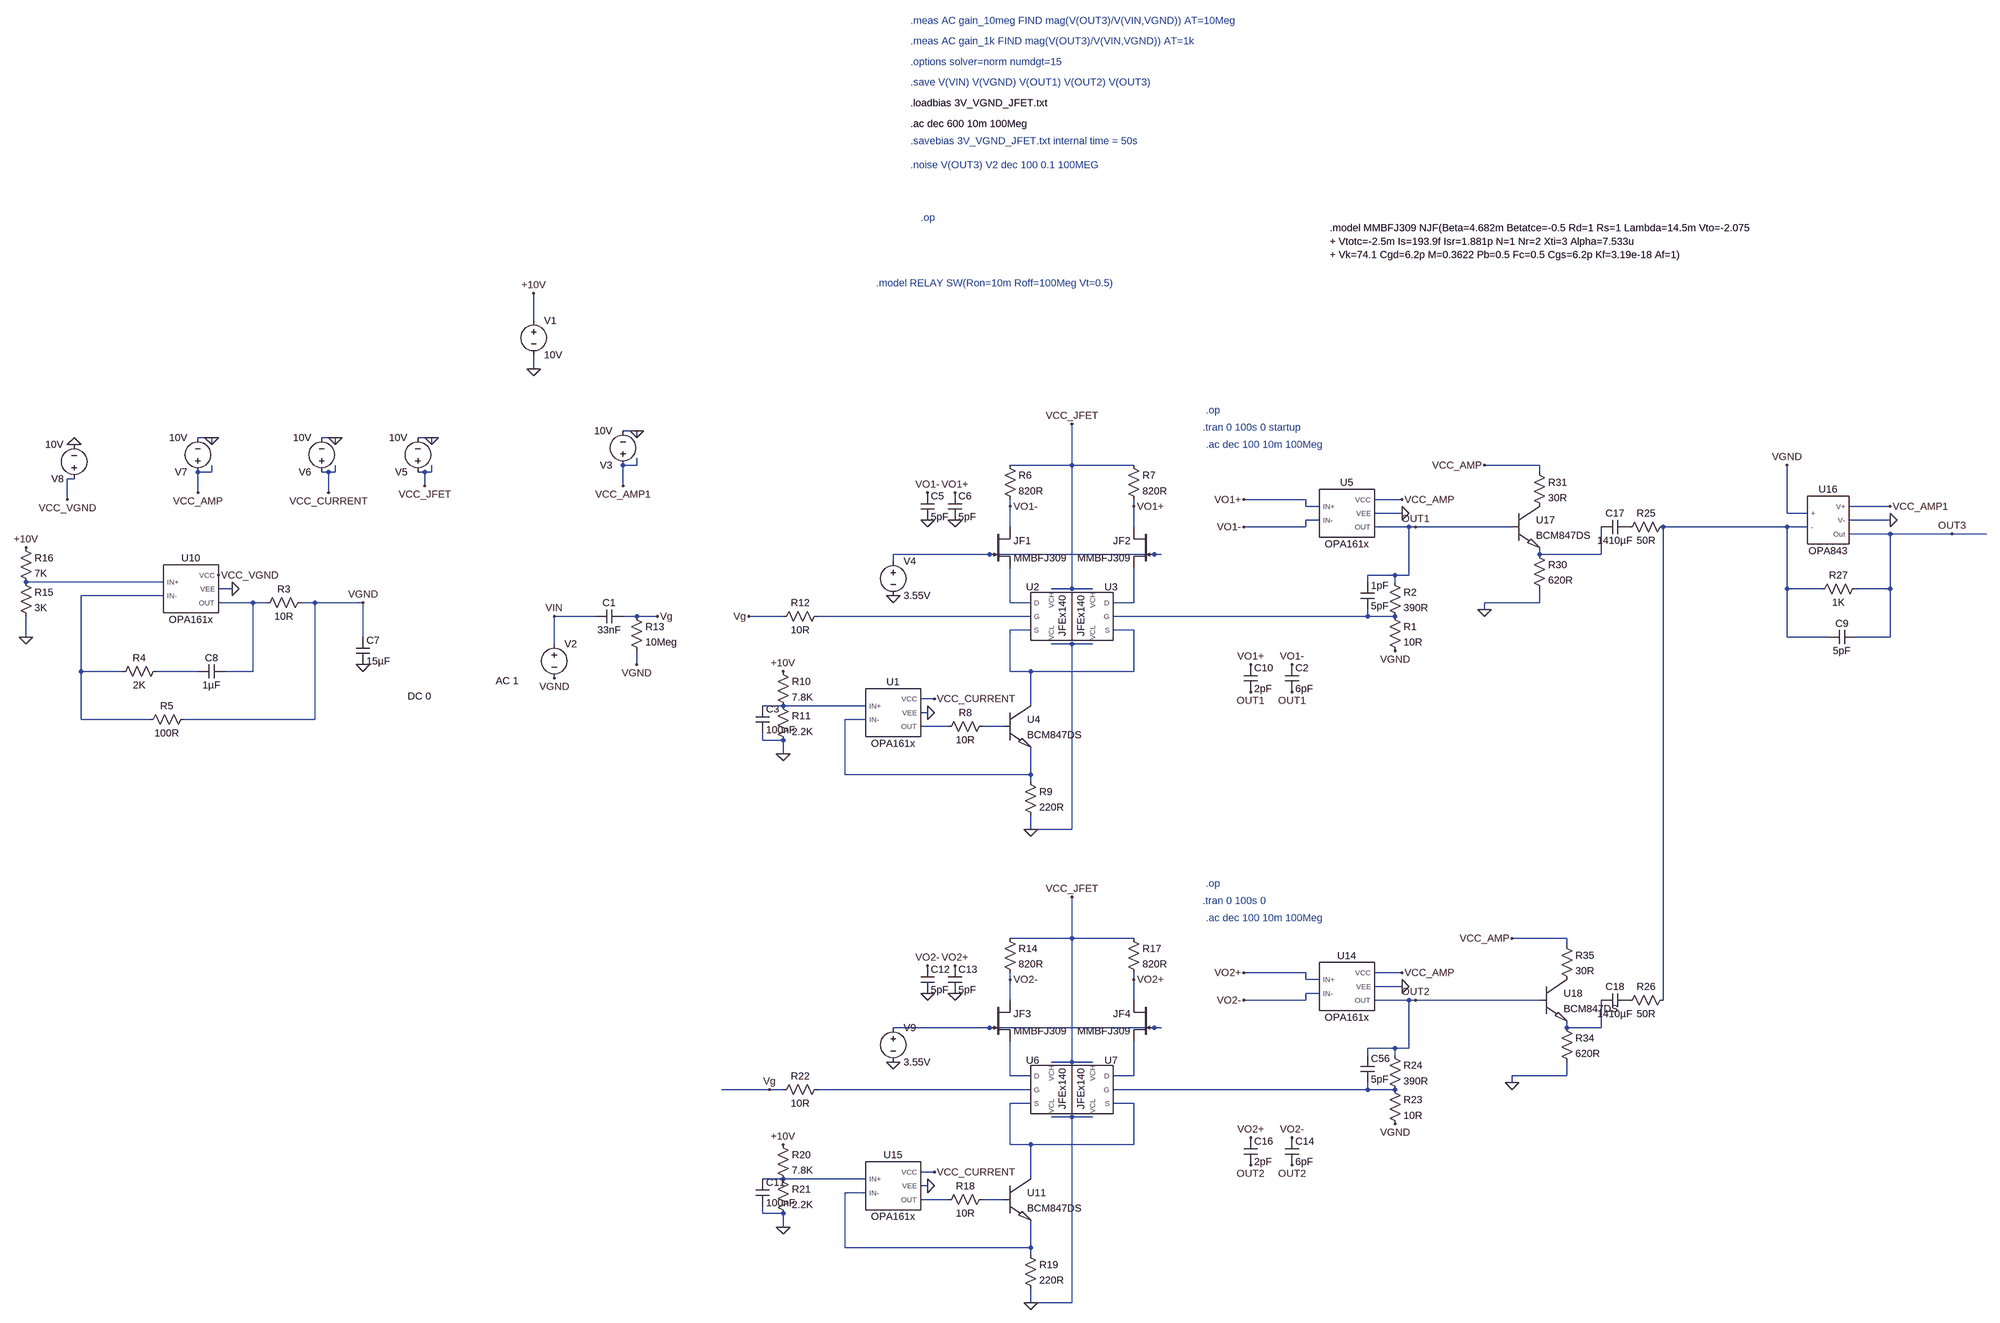
[diagram p0: schematic blueprint_bias_AC_3V_VGND__.asc]
blueprint_bias_AC_3V_VGND__.asc, the LTspice schematic file:
Version 4.1
SHEET 1 3036 4404
WIRE -1888 -272 -1888 -336
WIRE -1888 -160 -1888 -192
WIRE -1648 -16 -1680 -16
WIRE -2704 0 -2736 0
WIRE -2416 0 -2448 0
WIRE -2192 0 -2224 0
WIRE -1648 0 -1648 -16
WIRE -2704 16 -2704 0
WIRE -2416 16 -2416 0
WIRE -2192 16 -2192 0
WIRE -1648 64 -1648 48
WIRE -1648 64 -1680 64
WIRE -592 64 -592 -32
WIRE -592 64 -736 64
WIRE -448 64 -592 64
WIRE 496 64 368 64
WIRE -2704 80 -2704 64
WIRE -2704 80 -2736 80
WIRE -2432 80 -2448 80
WIRE -2416 80 -2416 64
WIRE -2416 80 -2432 80
WIRE -2208 80 -2224 80
WIRE -2192 80 -2192 64
WIRE -2192 80 -2208 80
WIRE 496 80 496 64
WIRE -3024 96 -3040 96
WIRE -2208 112 -2208 80
WIRE -1680 112 -1680 64
WIRE -2736 128 -2736 80
WIRE -2432 128 -2432 80
WIRE -3040 144 -3040 96
WIRE -48 144 -192 144
WIRE 176 144 112 144
WIRE -736 160 -736 144
WIRE -448 160 -448 144
WIRE -48 160 -48 144
WIRE -16 160 -48 160
WIRE 1312 160 1216 160
WIRE 176 176 112 176
WIRE 1072 176 1072 64
WIRE 1120 176 1072 176
WIRE -16 192 -48 192
WIRE 1312 192 1216 192
WIRE -736 208 -736 160
WIRE -448 208 -448 160
WIRE -48 208 -48 192
WIRE -48 208 -192 208
WIRE 192 208 112 208
WIRE 208 208 192 208
WIRE 432 208 208 208
WIRE 1072 208 784 208
WIRE 1120 208 1072 208
WIRE 1312 224 1216 224
WIRE 1456 224 1312 224
WIRE 1536 224 1456 224
WIRE -784 272 -1008 272
WIRE -400 272 -784 272
WIRE -384 272 -400 272
WIRE 496 272 496 256
WIRE 640 272 640 208
WIRE 640 272 496 272
WIRE -1008 288 -1008 272
WIRE 160 320 96 320
WIRE 192 320 192 208
WIRE 192 320 160 320
WIRE -2816 336 -3136 336
WIRE 96 336 96 320
WIRE 160 336 160 320
WIRE -2656 352 -2688 352
WIRE -592 352 -592 64
WIRE -592 352 -640 352
WIRE -544 352 -592 352
WIRE 1072 352 1072 208
WIRE 1152 352 1072 352
WIRE 1312 352 1312 224
WIRE 1312 352 1232 352
WIRE -2816 368 -3008 368
WIRE -2608 384 -2688 384
WIRE -2576 384 -2608 384
WIRE -2464 384 -2496 384
WIRE -2352 384 -2464 384
WIRE -736 384 -736 304
WIRE -688 384 -736 384
WIRE -448 384 -448 304
WIRE -448 384 -496 384
WIRE 496 384 496 352
WIRE 496 384 368 384
WIRE 368 400 368 384
WIRE -1744 416 -1840 416
WIRE -1648 416 -1680 416
WIRE -1600 416 -1648 416
WIRE -1264 416 -1344 416
WIRE -688 416 -1184 416
WIRE 96 416 96 400
WIRE 96 416 -496 416
WIRE 160 416 96 416
WIRE -688 448 -736 448
WIRE -448 448 -496 448
WIRE -3136 464 -3136 416
WIRE -2352 464 -2352 384
WIRE 1072 464 1072 352
WIRE 1168 464 1072 464
WIRE 1312 464 1312 352
WIRE 1312 464 1232 464
WIRE -1840 480 -1840 416
WIRE -592 480 -640 480
WIRE -544 480 -592 480
WIRE -1648 528 -1648 496
WIRE -3008 544 -3008 368
WIRE -2912 544 -3008 544
WIRE -2736 544 -2832 544
WIRE -2608 544 -2608 384
WIRE -2608 544 -2672 544
WIRE -736 544 -736 448
WIRE -688 544 -736 544
WIRE -448 544 -448 448
WIRE -448 544 -688 544
WIRE -912 608 -944 608
WIRE -1264 624 -1312 624
WIRE -1072 624 -1264 624
WIRE -688 624 -688 544
WIRE -928 640 -944 640
WIRE -3008 656 -3008 544
WIRE -2848 656 -3008 656
WIRE -2464 656 -2464 384
WIRE -2464 656 -2768 656
WIRE -1072 656 -1120 656
WIRE -880 672 -944 672
WIRE -752 672 -800 672
WIRE -1312 704 -1312 688
WIRE -1264 704 -1312 704
WIRE -1264 736 -1264 704
WIRE -1120 784 -1120 656
WIRE -688 784 -688 720
WIRE -688 784 -1120 784
WIRE -688 800 -688 784
WIRE -688 912 -688 880
WIRE -592 912 -592 480
WIRE -592 912 -688 912
WIRE -592 1232 -592 1136
WIRE -592 1232 -736 1232
WIRE -448 1232 -592 1232
WIRE 560 1232 432 1232
WIRE 560 1248 560 1232
WIRE -48 1312 -192 1312
WIRE 176 1312 112 1312
WIRE -736 1328 -736 1312
WIRE -448 1328 -448 1312
WIRE -48 1328 -48 1312
WIRE -16 1328 -48 1328
WIRE 176 1344 112 1344
WIRE -16 1360 -48 1360
WIRE -736 1376 -736 1328
WIRE -448 1376 -448 1328
WIRE -48 1376 -48 1360
WIRE -48 1376 -192 1376
WIRE 192 1376 112 1376
WIRE 208 1376 192 1376
WIRE 496 1376 208 1376
WIRE 784 1376 784 208
WIRE -784 1440 -1008 1440
WIRE -400 1440 -784 1440
WIRE -384 1440 -400 1440
WIRE 560 1440 560 1424
WIRE 640 1440 640 1376
WIRE 640 1440 560 1440
WIRE 160 1488 96 1488
WIRE 192 1488 192 1376
WIRE 192 1488 160 1488
WIRE 96 1504 96 1488
WIRE 160 1504 160 1488
WIRE -592 1520 -592 1232
WIRE -592 1520 -640 1520
WIRE -544 1520 -592 1520
WIRE -736 1552 -736 1472
WIRE -688 1552 -736 1552
WIRE -448 1552 -448 1472
WIRE -448 1552 -496 1552
WIRE 560 1552 560 1520
WIRE 560 1552 432 1552
WIRE 432 1568 432 1552
WIRE -1296 1584 -1408 1584
WIRE -1264 1584 -1296 1584
WIRE -688 1584 -1184 1584
WIRE 96 1584 96 1568
WIRE 96 1584 -496 1584
WIRE 160 1584 96 1584
WIRE -688 1616 -736 1616
WIRE -448 1616 -496 1616
WIRE -592 1648 -640 1648
WIRE -544 1648 -592 1648
WIRE -736 1712 -736 1616
WIRE -688 1712 -736 1712
WIRE -448 1712 -448 1616
WIRE -448 1712 -688 1712
WIRE -912 1776 -944 1776
WIRE -1264 1792 -1312 1792
WIRE -1072 1792 -1264 1792
WIRE -688 1792 -688 1712
WIRE -928 1808 -944 1808
WIRE -1072 1824 -1120 1824
WIRE -880 1840 -944 1840
WIRE -752 1840 -800 1840
WIRE -1312 1872 -1312 1856
WIRE -1264 1872 -1312 1872
WIRE -1264 1904 -1264 1872
WIRE -1120 1952 -1120 1824
WIRE -688 1952 -688 1888
WIRE -688 1952 -1120 1952
WIRE -688 1968 -688 1952
WIRE -688 2080 -688 2048
WIRE -592 2080 -592 1648
WIRE -592 2080 -688 2080
FLAG -1888 -160 0
FLAG -1888 -336 +10V
FLAG -688 912 0
FLAG -1264 736 0
FLAG -1264 544 +10V
FLAG -928 640 0
FLAG -736 160 VO1-
FLAG -448 160 VO1+
FLAG -1840 416 VIN
FLAG -928 128 VO1-
FLAG -928 192 0
FLAG -864 128 VO1+
FLAG -864 192 0
FLAG -1008 368 0
FLAG -192 208 VO1-
FLAG -192 144 VO1+
FLAG -80 528 VO1-
FLAG 208 208 OUT1
FLAG -80 592 OUT1
FLAG 176 176 0
FLAG 160 496 VGND
FLAG 176 144 VCC_AMP
FLAG -2736 128 VCC_AMP
FLAG -2432 128 VCC_CURRENT
FLAG -2208 112 VCC_JFET
FLAG -592 -32 VCC_JFET
FLAG -912 608 VCC_CURRENT
FLAG -2704 0 0
FLAG -2416 0 0
FLAG -2192 0 0
FLAG -1840 560 VGND
FLAG -2352 528 0
FLAG -3040 144 VCC_VGND
FLAG -3024 16 0
FLAG -2688 320 VCC_VGND
FLAG -2656 352 0
FLAG -3136 464 0
FLAG -3136 256 +10V
FLAG -176 592 OUT1
FLAG -176 528 VO1+
FLAG -688 2080 0
FLAG -1264 1904 0
FLAG -1264 1712 +10V
FLAG -928 1808 0
FLAG -736 1328 VO2-
FLAG -448 1328 VO2+
FLAG -1296 1584 Vg
FLAG -928 1296 VO2-
FLAG -928 1360 0
FLAG -864 1296 VO2+
FLAG -864 1360 0
FLAG -1008 1520 0
FLAG -192 1376 VO2-
FLAG -192 1312 VO2+
FLAG -80 1696 VO2-
FLAG 208 1376 OUT2
FLAG -80 1760 OUT2
FLAG 176 1344 0
FLAG 160 1664 VGND
FLAG 176 1312 VCC_AMP
FLAG -592 1136 VCC_JFET
FLAG -912 1776 VCC_CURRENT
FLAG -176 1760 OUT2
FLAG -176 1696 VO2+
FLAG -1600 416 Vg
FLAG -1344 416 Vg
FLAG 1072 64 VGND
FLAG 1312 192 0
FLAG 1456 224 OUT3
FLAG -1680 112 VCC_AMP1
FLAG -1648 -16 0
FLAG 1312 160 VCC_AMP1
FLAG -2352 384 VGND
FLAG 368 400 0
FLAG 368 64 VCC_AMP
FLAG 432 1568 0
FLAG 432 1232 VCC_AMP
FLAG -1648 528 VGND
SYMBOL voltage -1888 -288 R0
WINDOW 123 0 0 Left 0
WINDOW 39 0 0 Left 0
SYMATTR InstName V1
SYMATTR Value 10V
SYMBOL JFEx140 -640 416 R0
SYMATTR InstName U2
SYMBOL JFEx140 -544 416 M0
SYMATTR InstName U3
SYMBOL res -752 48 R0
SYMATTR InstName R6
SYMATTR Value 820R
SYMBOL res -464 48 R0
SYMATTR InstName R7
SYMATTR Value 820R
SYMBOL BCM847DS -752 624 R0
SYMATTR InstName U4
SYMBOL res -784 656 R90
WINDOW 0 0 56 VBottom 2
WINDOW 3 32 56 VTop 2
SYMATTR InstName R8
SYMATTR Value 10R
SYMBOL res -704 784 R0
SYMATTR InstName R9
SYMATTR Value 220R
SYMBOL res -1280 528 R0
SYMATTR InstName R10
SYMATTR Value 7.8K
SYMBOL res -1280 608 R0
SYMATTR InstName R11
SYMATTR Value 2.2K
SYMBOL cap -1328 624 R0
SYMATTR InstName C3
SYMATTR Value 100nF
SYMBOL res -1168 400 R90
WINDOW 0 0 56 VBottom 2
WINDOW 3 32 56 VTop 2
SYMATTR InstName R12
SYMATTR Value 10R
SYMBOL voltage -1840 464 R0
WINDOW 3 -408 138 Left 2
WINDOW 123 -136 102 Left 2
WINDOW 39 0 0 Left 0
SYMATTR Value DC 0
SYMATTR Value2 AC 1
SYMATTR InstName V2
SYMBOL cap -944 128 R0
SYMATTR InstName C5
SYMATTR Value 5pF
SYMBOL cap -880 128 R0
SYMATTR InstName C6
SYMATTR Value 5pF
SYMBOL voltage -1008 272 R0
WINDOW 123 0 0 Left 0
WINDOW 39 0 0 Left 0
SYMATTR InstName V4
SYMATTR Value 3.55V
SYMBOL OPA161x 48 176 R0
SYMATTR InstName U5
SYMBOL cap -96 528 R0
SYMATTR InstName C2
SYMATTR Value 6pF
SYMBOL res 144 400 R0
SYMATTR InstName R1
SYMATTR Value 10R
SYMBOL res 144 320 R0
SYMATTR InstName R2
SYMATTR Value 390R
SYMBOL cap 80 336 R0
SYMATTR InstName 1pF
SYMATTR Value 5pF
SYMBOL OPA161x -1008 640 R0
SYMATTR InstName U1
SYMBOL OPA161x -2752 352 R0
SYMATTR InstName U10
SYMBOL res -2480 368 R90
WINDOW 0 0 56 VBottom 2
WINDOW 3 32 56 VTop 2
SYMATTR InstName R3
SYMATTR Value 10R
SYMBOL cap -2368 464 R0
SYMATTR InstName C7
SYMATTR Value 15µF
SYMATTR SpiceLine Rser=10mR Lser=1nH
SYMBOL cap -2672 528 R90
WINDOW 0 0 32 VBottom 2
WINDOW 3 32 32 VTop 2
SYMATTR InstName C8
SYMATTR Value 1µF
SYMBOL res -2816 528 R90
WINDOW 0 0 56 VBottom 2
WINDOW 3 32 56 VTop 2
SYMATTR InstName R4
SYMATTR Value 2K
SYMBOL res -2752 640 R90
WINDOW 0 0 56 VBottom 2
WINDOW 3 32 56 VTop 2
SYMATTR InstName R5
SYMATTR Value 100R
SYMBOL res -3152 320 R0
SYMATTR InstName R15
SYMATTR Value 3K
SYMBOL res -3152 240 R0
SYMATTR InstName R16
SYMATTR Value 7K
SYMBOL cap -192 528 R0
SYMATTR InstName C10
SYMATTR Value 2pF
SYMBOL JFEx140 -640 1584 R0
SYMATTR InstName U6
SYMBOL JFEx140 -544 1584 M0
SYMATTR InstName U7
SYMBOL res -752 1216 R0
SYMATTR InstName R14
SYMATTR Value 820R
SYMBOL res -464 1216 R0
SYMATTR InstName R17
SYMATTR Value 820R
SYMBOL BCM847DS -752 1792 R0
SYMATTR InstName U11
SYMBOL res -784 1824 R90
WINDOW 0 0 56 VBottom 2
WINDOW 3 32 56 VTop 2
SYMATTR InstName R18
SYMATTR Value 10R
SYMBOL res -704 1952 R0
SYMATTR InstName R19
SYMATTR Value 220R
SYMBOL res -1280 1696 R0
SYMATTR InstName R20
SYMATTR Value 7.8K
SYMBOL res -1280 1776 R0
SYMATTR InstName R21
SYMATTR Value 2.2K
SYMBOL cap -1328 1792 R0
SYMATTR InstName C11
SYMATTR Value 100nF
SYMBOL res -1168 1568 R90
WINDOW 0 0 56 VBottom 2
WINDOW 3 32 56 VTop 2
SYMATTR InstName R22
SYMATTR Value 10R
SYMBOL cap -944 1296 R0
SYMATTR InstName C12
SYMATTR Value 5pF
SYMBOL cap -880 1296 R0
SYMATTR InstName C13
SYMATTR Value 5pF
SYMBOL voltage -1008 1424 R0
WINDOW 123 0 0 Left 0
WINDOW 39 0 0 Left 0
SYMATTR InstName V9
SYMATTR Value 3.55V
SYMBOL OPA161x 48 1344 R0
SYMATTR InstName U14
SYMBOL cap -96 1696 R0
SYMATTR InstName C14
SYMATTR Value 6pF
SYMBOL res 144 1568 R0
SYMATTR InstName R23
SYMATTR Value 10R
SYMBOL res 144 1488 R0
SYMATTR InstName R24
SYMATTR Value 390R
SYMBOL cap 80 1504 R0
SYMATTR InstName C56
SYMATTR Value 5pF
SYMBOL OPA161x -1008 1808 R0
SYMATTR InstName U15
SYMBOL cap -192 1696 R0
SYMATTR InstName C16
SYMATTR Value 2pF
SYMBOL cap 704 192 R90
WINDOW 0 0 32 VBottom 2
WINDOW 3 32 32 VTop 2
SYMATTR InstName C17
SYMATTR Value 1410µF
SYMBOL res 800 192 R90
WINDOW 0 0 56 VBottom 2
WINDOW 3 32 56 VTop 2
SYMATTR InstName R25
SYMATTR Value 50R
SYMBOL cap 704 1360 R90
WINDOW 0 0 32 VBottom 2
WINDOW 3 32 32 VTop 2
SYMATTR InstName C18
SYMATTR Value 1410µF
SYMBOL res 800 1360 R90
WINDOW 0 0 56 VBottom 2
WINDOW 3 32 56 VTop 2
SYMATTR InstName R26
SYMATTR Value 50R
SYMBOL res 1248 336 R90
WINDOW 0 0 56 VBottom 2
WINDOW 3 32 56 VTop 2
SYMATTR InstName R27
SYMATTR Value 1K
SYMBOL OPA843 1168 192 R0
SYMATTR InstName U16
SYMBOL cap 1232 448 R90
WINDOW 0 0 32 VBottom 2
WINDOW 3 32 32 VTop 2
SYMATTR InstName C9
SYMATTR Value 5pF
SYMBOL BCM847DS 432 160 R0
SYMATTR InstName U17
SYMBOL res 480 256 R0
SYMATTR InstName R30
SYMATTR Value 620R
SYMBOL res 480 64 R0
SYMATTR InstName R31
SYMATTR Value 30R
SYMBOL BCM847DS 496 1328 R0
SYMATTR InstName U18
SYMBOL res 544 1424 R0
SYMATTR InstName R34
SYMATTR Value 620R
SYMBOL res 544 1232 R0
SYMATTR InstName R35
SYMATTR Value 30R
SYMBOL njf -784 208 R0
SYMATTR InstName JF1
SYMATTR Value MMBFJ309
SYMBOL njf -400 208 M0
SYMATTR InstName JF2
SYMATTR Value MMBFJ309
SYMBOL njf -784 1376 R0
SYMATTR InstName JF3
SYMATTR Value MMBFJ309
SYMBOL njf -400 1376 M0
SYMATTR InstName JF4
SYMATTR Value MMBFJ309
SYMBOL cap -1744 432 R270
WINDOW 0 32 32 VTop 2
WINDOW 3 0 32 VBottom 2
SYMATTR InstName C1
SYMATTR Value 33nF
SYMBOL res -1664 400 R0
SYMATTR InstName R13
SYMATTR Value 10Meg
SYMBOL voltage -1680 80 R180
WINDOW 123 0 0 Left 0
WINDOW 39 0 0 Left 0
SYMATTR InstName V3
SYMATTR Value 10V
SYMBOL voltage -2224 96 R180
WINDOW 123 0 0 Left 0
WINDOW 39 0 0 Left 0
SYMATTR InstName V5
SYMATTR Value 10V
SYMBOL voltage -2448 96 R180
WINDOW 123 0 0 Left 0
WINDOW 39 0 0 Left 0
SYMATTR InstName V6
SYMATTR Value 10V
SYMBOL voltage -2736 96 R180
WINDOW 123 0 0 Left 0
WINDOW 39 0 0 Left 0
SYMATTR InstName V7
SYMATTR Value 10V
SYMBOL voltage -3024 112 R180
WINDOW 123 0 0 Left 0
WINDOW 39 0 0 Left 0
SYMATTR InstName V8
SYMATTR Value 10V
TEXT -280 16 Left 2 ;.ac dec 100 10m 100Meg
TEXT -288 -24 Left 2 ;.tran 0 100s 0 startup
TEXT -280 -64 Left 2 ;.op
TEXT -944 -512 Left 2 ;.op
TEXT -1048 -360 Left 2 ;.model RELAY SW(Ron=10m Roff=100Meg Vt=0.5)
TEXT -968 -840 Left 2 ;.noise V(OUT3) V2 dec 100 0.1 100MEG
TEXT -280 1184 Left 2 ;.ac dec 100 10m 100Meg
TEXT -288 1144 Left 2 ;.tran 0 100s 0
TEXT -280 1104 Left 2 ;.op
TEXT -968 -936 Left 2 !.ac dec 600 10m 100Meg
TEXT -968 -984 Left 2 !.loadbias 3V_VGND_JFET.txt
TEXT -968 -1032 Left 2 ;.save V(VIN) V(VGND) V(OUT1) V(OUT2) V(OUT3)
TEXT -968 -1080 Left 2 ;.options solver=norm numdgt=15
TEXT -968 -1128 Left 2 ;.meas AC gain_1k FIND mag(V(OUT3)/V(VIN,VGND)) AT=1k
TEXT -968 -1176 Left 2 ;.meas AC gain_10meg FIND mag(V(OUT3)/V(VIN,VGND)) AT=10Meg
TEXT -968 -896 Left 2 ;.savebias 3V_VGND_JFET.txt internal time = 50s
TEXT 8 -488 Left 2 !.model MMBFJ309 NJF(Beta=4.682m Betatce=-0.5 Rd=1 Rs=1 Lambda=14.5m Vto=-2.075\n+ Vtotc=-2.5m Is=193.9f Isr=1.881p N=1 Nr=2 Xti=3 Alpha=7.533u\n+ Vk=74.1 Cgd=6.2p M=0.3622 Pb=0.5 Fc=0.5 Cgs=6.2p Kf=3.19e-18 Af=1)

The netlist it stands for:
* blueprint_bias_AC_3V_VGND__.asc
V1 +10V 0 10V
X§U2 N007 N009 N011 VCC_JFET 0 JFEx140  ; pins D G S VCH VCL
X§U3 N008 N010 N011 VCC_JFET 0 JFEx140  ; pins D G S VCH VCL
R6 VCC_JFET VO1- 820R
R7 VCC_JFET VO1+ 820R
X§U4 N011 N016 N014 BCM847DS  ; pins C B E
R8 N016 N015 10R
R9 N014 0 220R
R10 +10V N013 7.8K
R11 N013 0 2.2K
C3 N013 0 100nF
R12 N009 Vg 10R
V2 VIN VGND DC 0 AC 1
C5 VO1- 0 5pF
C6 VO1+ 0 5pF
V4 N002 0 3.55V
X§U5 VO1+ VO1- VCC_AMP 0 OUT1 OPA161x  ; pins IN+ IN- VCC VEE OUT
C2 VO1- OUT1 6pF
R1 N010 VGND 10R
R2 OUT1 N010 390R
C§1pF OUT1 N010 5pF
X§U1 N013 N014 VCC_CURRENT 0 N015 OPA161x  ; pins IN+ IN- VCC VEE OUT
X§U10 N004 N005 VCC_VGND 0 N006 OPA161x  ; pins IN+ IN- VCC VEE OUT
R3 VGND N006 10R
C7 VGND 0 15µF Rser=10mR Lser=1nH
C8 N006 N012 1µF
R4 N012 N005 2K
R5 VGND N005 100R
R15 N004 0 3K
R16 +10V N004 7K
C10 VO1+ OUT1 2pF
X§U6 N019 N021 N023 VCC_JFET 0 JFEx140  ; pins D G S VCH VCL
X§U7 N020 N022 N023 VCC_JFET 0 JFEx140  ; pins D G S VCH VCL
R14 VCC_JFET VO2- 820R
R17 VCC_JFET VO2+ 820R
X§U11 N023 N027 N025 BCM847DS  ; pins C B E
R18 N027 N026 10R
R19 N025 0 220R
R20 +10V N024 7.8K
R21 N024 0 2.2K
C11 N024 0 100nF
R22 N021 Vg 10R
C12 VO2- 0 5pF
C13 VO2+ 0 5pF
V9 N017 0 3.55V
X§U14 VO2+ VO2- VCC_AMP 0 OUT2 OPA161x  ; pins IN+ IN- VCC VEE OUT
C14 VO2- OUT2 6pF
R23 N022 VGND 10R
R24 OUT2 N022 390R
C56 OUT2 N022 5pF
X§U15 N024 N025 VCC_CURRENT 0 N026 OPA161x  ; pins IN+ IN- VCC VEE OUT
C16 VO2+ OUT2 2pF
C17 P001 N003 1410µF
R25 N001 P001 50R
C18 P002 N018 1410µF
R26 N001 P002 50R
R27 OUT3 N001 1K
X§U16 VGND N001 VCC_AMP1 0 OUT3 OPA843  ; pins + - V+ V- Out
C9 OUT3 N001 5pF
X§U17 P003 OUT1 N003 BCM847DS  ; pins C B E
R30 N003 0 620R
R31 VCC_AMP P003 30R
X§U18 P004 OUT2 N018 BCM847DS  ; pins C B E
R34 N018 0 620R
R35 VCC_AMP P004 30R
JF1 VO1- N002 N007 MMBFJ309
JF2 VO1+ N002 N008 MMBFJ309
JF3 VO2- N017 N019 MMBFJ309
JF4 VO2+ N017 N020 MMBFJ309
C1 VIN Vg 33nF
R13 Vg VGND 10Meg
V3 VCC_AMP1 0 10V
V5 VCC_JFET 0 10V
V6 VCC_CURRENT 0 10V
V7 VCC_AMP 0 10V
V8 VCC_VGND 0 10V
.model NJF NJF
.model PJF PJF
.lib standard.jft
* .ac dec 100 10m 100Meg
* .tran 0 100s 0 startup
* .op
* .op
* .model RELAY SW(Ron=10m Roff=100Meg Vt=0.5)
* .noise V(OUT3) V2 dec 100 0.1 100MEG
* .ac dec 100 10m 100Meg
* .tran 0 100s 0
* .op
.ac dec 600 10m 100Meg
.loadbias 3V_VGND_JFET.txt
* .save V(VIN) V(VGND) V(OUT1) V(OUT2) V(OUT3)
* .options solver=norm numdgt=15
* .meas AC gain_1k FIND mag(V(OUT3)/V(VIN,VGND)) AT=1k
* .meas AC gain_10meg FIND mag(V(OUT3)/V(VIN,VGND)) AT=10Meg
* .savebias 3V_VGND_JFET.txt internal time = 50s
.model MMBFJ309 NJF(Beta=4.682m Betatce=-0.5 Rd=1 Rs=1 Lambda=14.5m Vto=-2.075
+ Vtotc=-2.5m Is=193.9f Isr=1.881p N=1 Nr=2 Xti=3 Alpha=7.533u
+ Vk=74.1 Cgd=6.2p M=0.3622 Pb=0.5 Fc=0.5 Cgs=6.2p Kf=3.19e-18 Af=1)
.lib jfex140.lib
.lib BCM847.lib
.lib OPA161x.LIB
.lib OPA843_LT2410.lib
.backanno
.end